# Altium schematic sheet Extended_design2_unvalidated.SchDoc
size A0; SheetNumber: 2; SheetTotal: 2
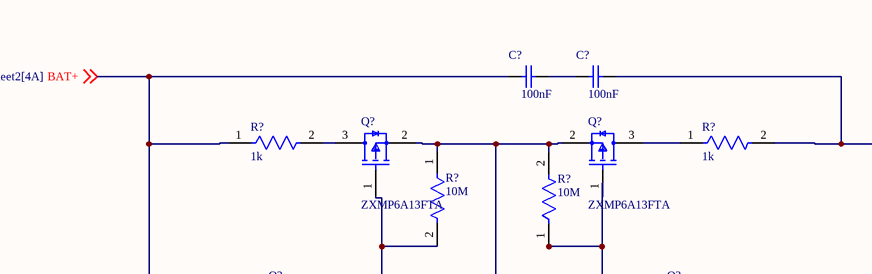
[diagram p0: Extended_design2_unvalidated.SchDoc, top left]
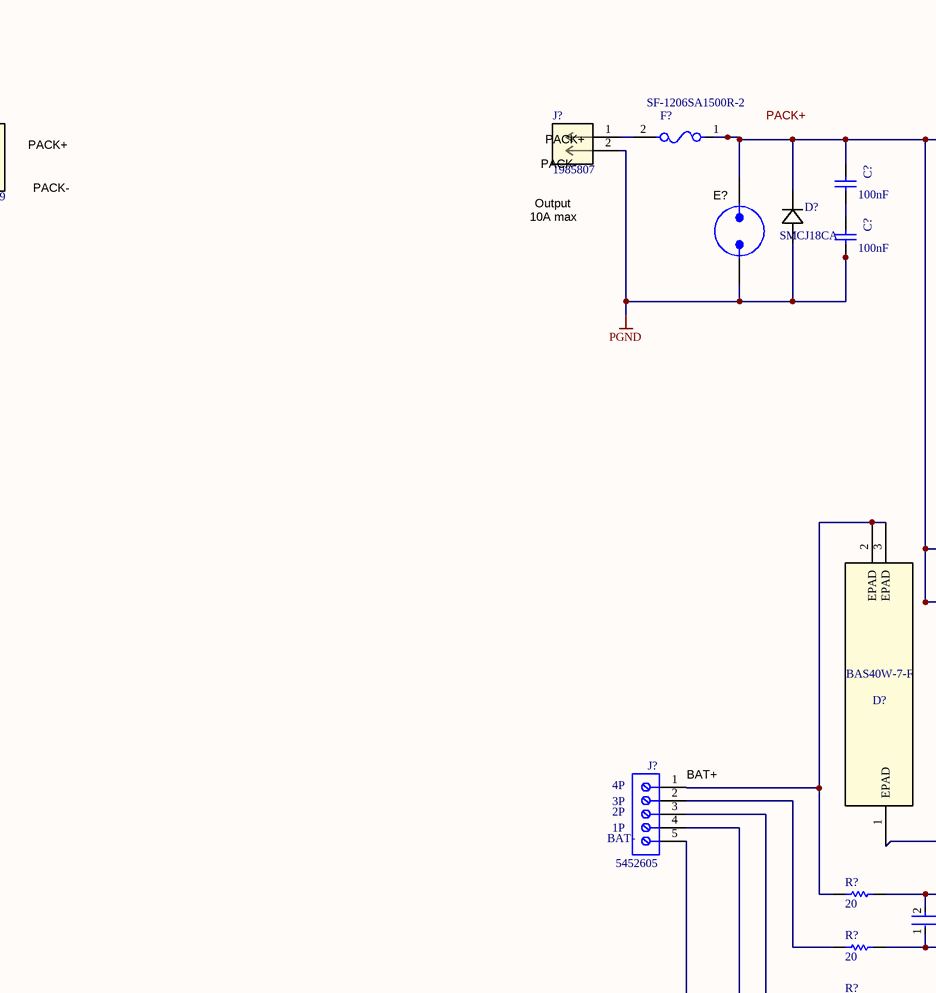
[diagram p1: Extended_design2_unvalidated.SchDoc, top middle]
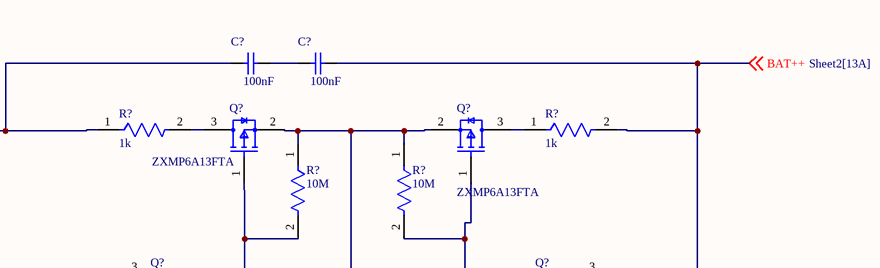
[diagram p2: Extended_design2_unvalidated.SchDoc, top right]
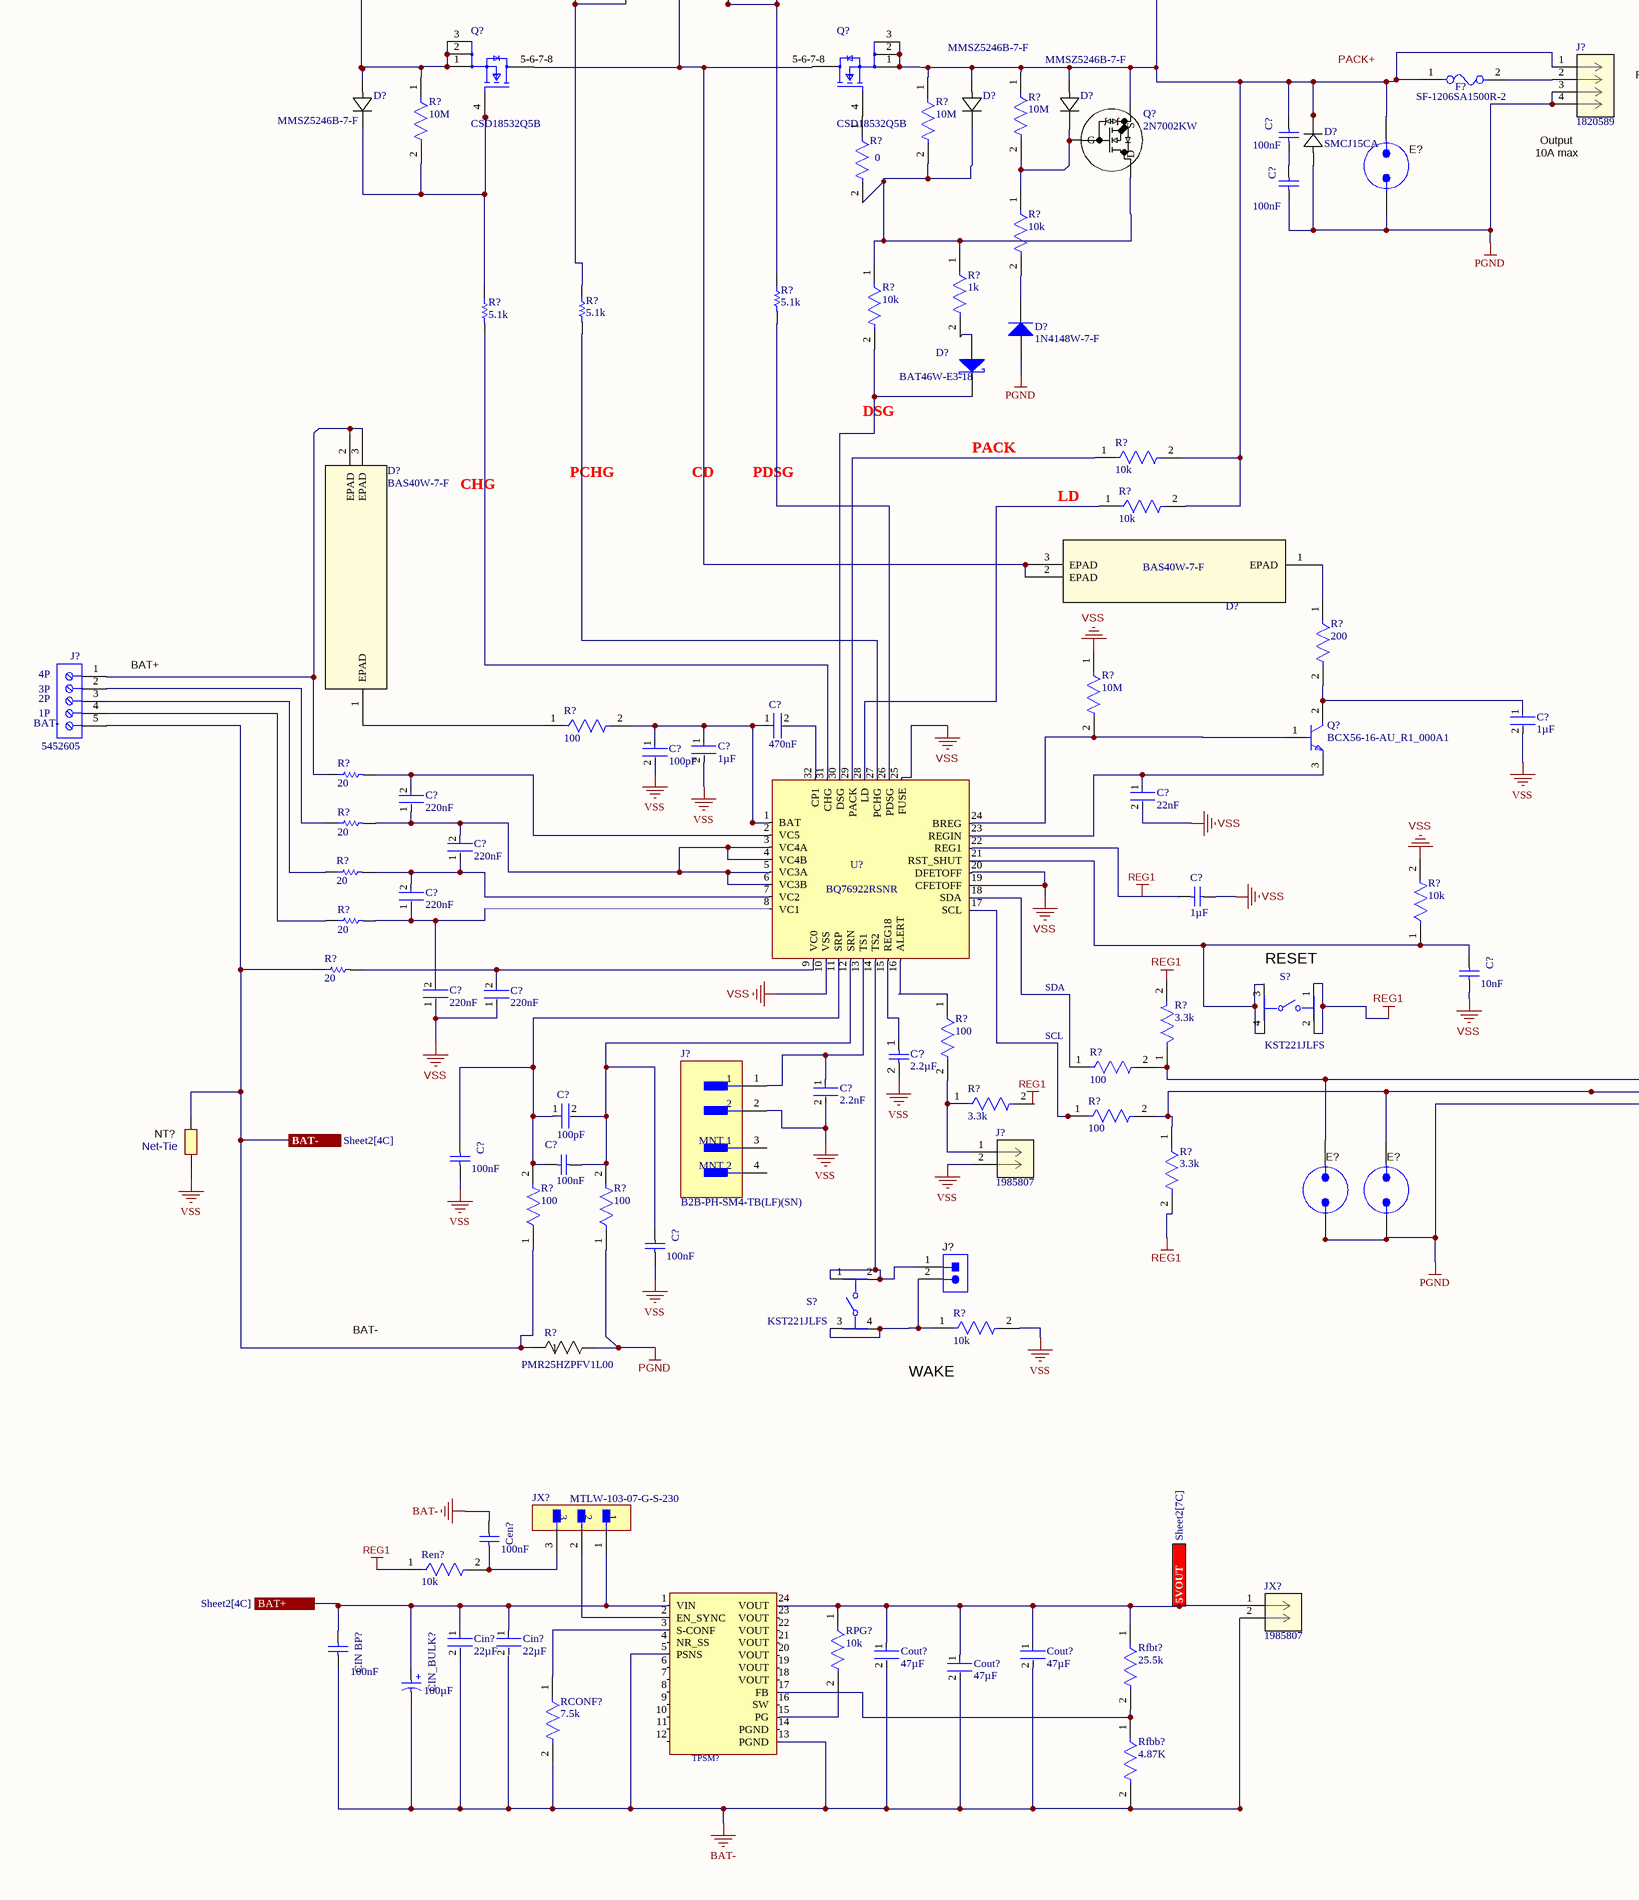
[diagram p3: Extended_design2_unvalidated.SchDoc, bottom left]
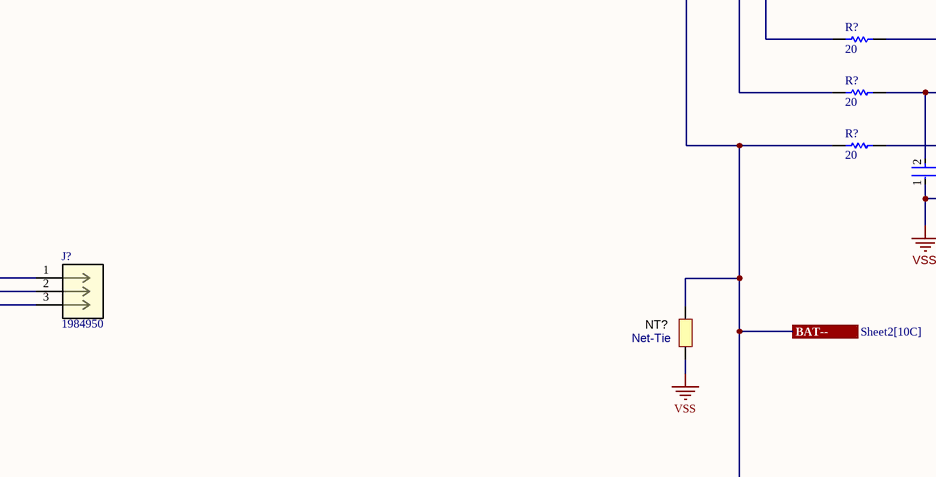
[diagram p4: Extended_design2_unvalidated.SchDoc, bottom middle]
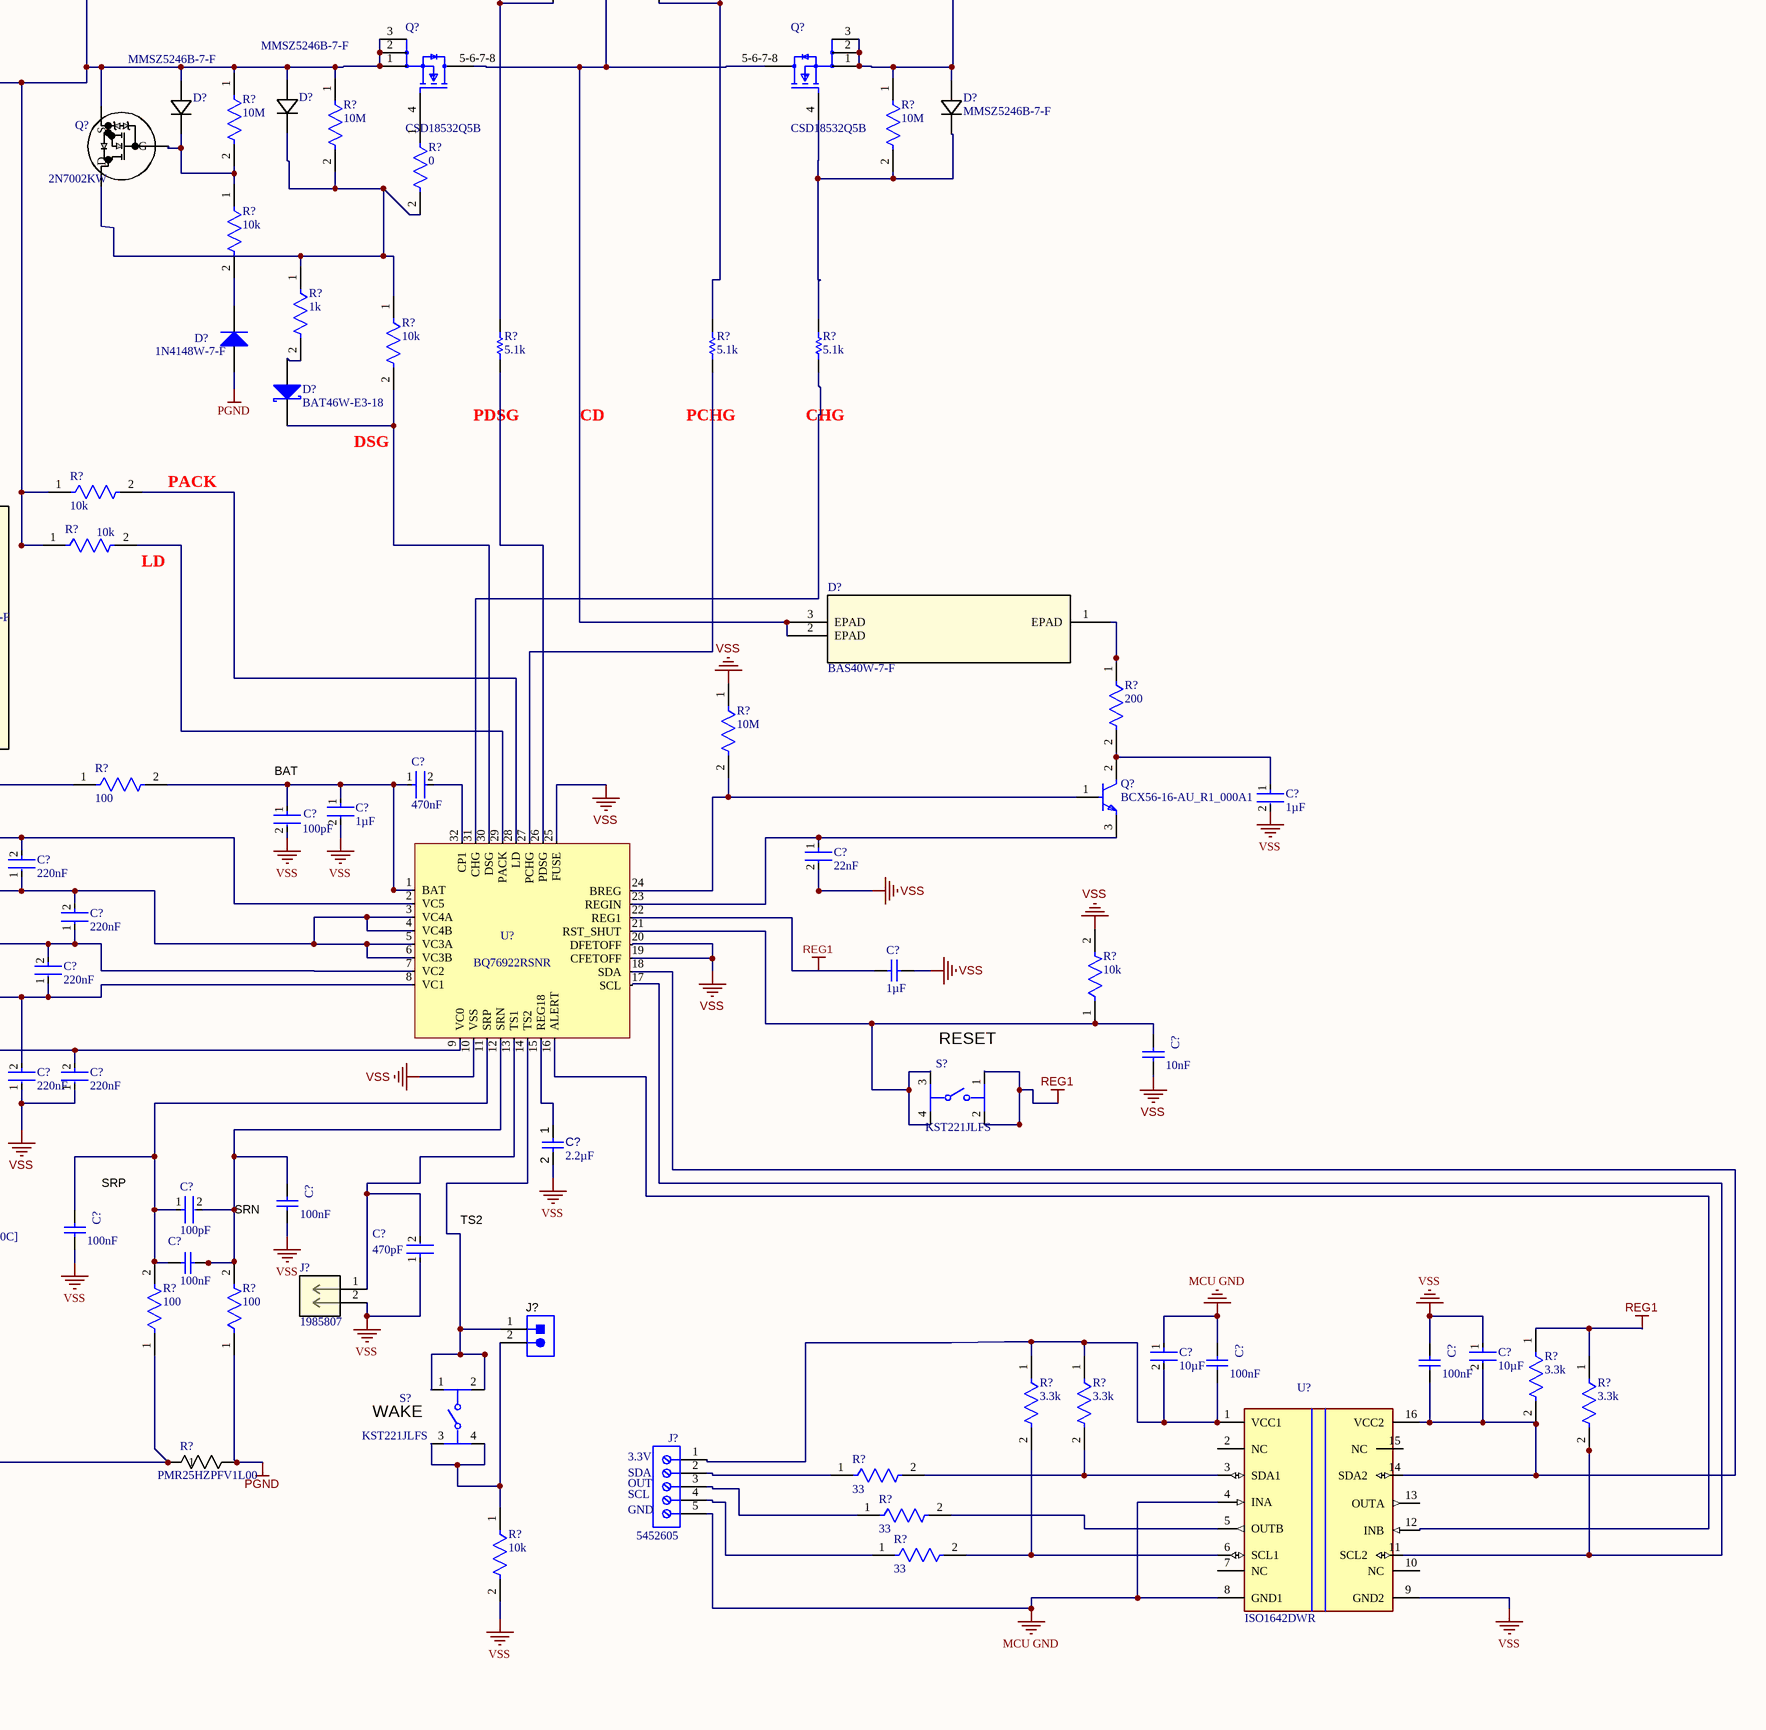
[diagram p5: Extended_design2_unvalidated.SchDoc, bottom right]

## Parts
(Parts that share a designator on the sheet are numbered #1, #2 ... from top to bottom, then left to right.)
C?#1  value 100nF  [WCAP-CSGP_0603_L1.6W0.8H0.8_Reflow]  (hidden comment: 885012206095)
C?#2  value 100nF  [WCAP-CSGP_0603_L1.6W0.8H0.8_Reflow]  (hidden comment: 885012206095)
C?#3  value 100nF  [WCAP-CSGP_0603_L1.6W0.8H0.8_Reflow]  (hidden comment: 885012206095)
C?#4  value 100nF  [WCAP-CSGP_0603_L1.6W0.8H0.8_Reflow]  (hidden comment: 885012206095)
C?#5  value 100nF  [WCAP-CSGP_0603_L1.6W0.8H0.8_Reflow]  (hidden comment: 885012206095)
C?#6  value 100nF  [WCAP-CSGP_0603_L1.6W0.8H0.8_Reflow]  (hidden comment: 885012206095)
C?#7  value 100nF  [WCAP-CSGP_0603_L1.6W0.8H0.8_Reflow]  (hidden comment: 885012206095)
C?#8  value 100nF  [WCAP-CSGP_0603_L1.6W0.8H0.8_Reflow]  (hidden comment: 885012206095)
C?#9  value 1µF  [FP-CGA5L-0_3-0_1-IPC_A]  (hidden comment: CGA5L3X7R1H105K160AB)
C?#10  value 470nF  [FP-GCM219-0_15-IPC_A]  (hidden comment: GCM219R71E474KA55D)
C?#11  value 1µF  [FP-CGA5L-0_3-0_1-IPC_A]  (hidden comment: CGA5L3X7R1H105K160AB)
C?#12  value 470nF  [FP-GCM219-0_15-IPC_A]  (hidden comment: GCM219R71E474KA55D)
C?#13  value 1µF  [FP-CGA5L-0_3-0_1-IPC_A]  (hidden comment: CGA5L3X7R1H105K160AB)
C?#14  value 1µF  [FP-CGA5L-0_3-0_1-IPC_A]  (hidden comment: CGA5L3X7R1H105K160AB)
C?#15  value 100pF  [FP-C0603C-CF-IPC_A]  (hidden comment: C0603C101J5GACTU)
C?#16  value 100pF  [FP-C0603C-CF-IPC_A]  (hidden comment: C0603C101J5GACTU)
C?#17  value 22nF  [FP-C0603C-CF-IPC_A]  (hidden comment: C0603C223K4RACTU)
C?#18  value 220nF  [FP-C1608-080-0_1-IPC_A]  (hidden comment: C1608X7R1H224K080AB)
C?#19  value 220nF  [FP-C1608-080-0_1-IPC_A]  (hidden comment: C1608X7R1H224K080AB)
C?#20  value 22nF  [FP-C0603C-CF-IPC_A]  (hidden comment: C0603C223K4RACTU)
C?#21  value 220nF  [FP-C1608-080-0_1-IPC_A]  (hidden comment: C1608X7R1H224K080AB)
C?#22  value 220nF  [FP-C1608-080-0_1-IPC_A]  (hidden comment: C1608X7R1H224K080AB)
C?#23  value 220nF  [FP-C1608-080-0_1-IPC_A]  (hidden comment: C1608X7R1H224K080AB)
C?#24  value 220nF  [FP-C1608-080-0_1-IPC_A]  (hidden comment: C1608X7R1H224K080AB)
C?#25  value 1µF  [CAPC2013X135X45ML10T25]  (hidden comment: GRM21BR71C105KA01L)
C?#26  value 1µF  [CAPC2013X135X45ML10T25]  (hidden comment: GRM21BR71C105KA01L)
C?#27  value 10nF  [WCAP-CSGP_0603_L1.6W0.8H0.8_Reflow]  (hidden comment: 885012206040)
C?#28  value 10nF  [WCAP-CSGP_0603_L1.6W0.8H0.8_Reflow]  (hidden comment: 885012206040)
C?#29  value 220nF  [FP-C1608-080-0_1-IPC_A]  (hidden comment: C1608X7R1H224K080AB)
C?#30  value 220nF  [FP-C1608-080-0_1-IPC_A]  (hidden comment: C1608X7R1H224K080AB)
C?#31  value 220nF  [FP-C1608-080-0_1-IPC_A]  (hidden comment: C1608X7R1H224K080AB)
C?#32  value 220nF  [FP-C1608-080-0_1-IPC_A]  (hidden comment: C1608X7R1H224K080AB)
C?#33  value 2.2µF  [FP-C2012-125-0_2-IPC_A]  (hidden comment: C2012X7R1C225K125AB)
C?#34  value 2.2µF  [FP-C2012-125-0_2-IPC_A]  (hidden comment: C2012X7R1C225K125AB)
C?#35  value 2.2nF  [FP-C0805C-DN-IPC_A]  (hidden comment: C0805C222K5RACTU)
C?#36  value 100nF  [WCAP-CSGP_0603_L1.6W0.8H0.8_Reflow]  (hidden comment: 885012206095)
C?#37  value 100nF  [WCAP-CSGP_0603_L1.6W0.8H0.8_Reflow]  (hidden comment: 885012206095)
C?#38  value 100pF  [FP-C0603C-CF-IPC_A]  (hidden comment: C0603C101J5GACTU)
C?#39  value 100pF  [FP-C0603C-CF-IPC_A]  (hidden comment: C0603C101J5GACTU)
C?#40  value 100nF  [WCAP-CSGP_0603_L1.6W0.8H0.8_Reflow]  (hidden comment: 885012206095)
C?#41  value 100nF  [WCAP-CSGP_0603_L1.6W0.8H0.8_Reflow]  (hidden comment: 885012206095)
C?#42  value 470pF  [FP-C0805C-DN-IPC_A]  (hidden comment: C0805C471J5GACTU)
C?#43  value 100nF  [WCAP-CSGP_0603_L1.6W0.8H0.8_Reflow]  (hidden comment: 885012206095)
C?#44  value 10µF  [FP-GRM21B-0_15-IPC_A]  (hidden comment: GRM21BR71A106KA73L)
C?#45  value 100nF  [WCAP-CSGP_0603_L1.6W0.8H0.8_Reflow]  (hidden comment: 885012206095)
C?#46  value 100nF  [WCAP-CSGP_0603_L1.6W0.8H0.8_Reflow]  (hidden comment: 885012206095)
C?#47  value 10µF  [FP-GRM21B-0_15-IPC_A]  (hidden comment: GRM21BR71A106KA73L)
C?#48  value 100nF  [WCAP-CSGP_0603_L1.6W0.8H0.8_Reflow]  (hidden comment: 885012206095)
Cen?  value 100nF  [WCAP-CSGP_0603_L1.6W0.8H0.8_Reflow]  (hidden comment: 885012206095)
Cin?#1  value 22µF  [FP-GRM21B-0_2-e0_2_0_7-MFG]  (hidden comment: GRM21BR61E226ME44L)
Cin?#2  value 22µF  [FP-GRM21B-0_2-e0_2_0_7-MFG]  (hidden comment: GRM21BR61E226ME44L)
CIN_BP?  value 100nF  [WCAP-CSGP_0603_L1.6W0.8H0.8_Reflow]  (hidden comment: 885012206095)
CIN_BULK?  value 100µF  [WCAP-ASLL_D6.3H7.7]  (hidden comment: 865060445005)
Cout?#1  value 47µF  [FP-GRM21B-0_2-e0_2_0_7-MFG]  (hidden comment: GRM21BR61A476ME15L)
Cout?#2  value 47µF  [FP-GRM21B-0_2-e0_2_0_7-MFG]  (hidden comment: GRM21BR61A476ME15L)
Cout?#3  value 47µF  [FP-GRM21B-0_2-e0_2_0_7-MFG]  (hidden comment: GRM21BR61A476ME15L)
D?#1  MMSZ5246B-7-F  [SOD123_DIO]
D?#2  MMSZ5246B-7-F  [SOD123_DIO]
D?#3  MMSZ5246B-7-F  [SOD123_DIO]
D?#4  MMSZ5246B-7-F  [SOD123_DIO]
D?#5  MMSZ5246B-7-F  [SOD123_DIO]
D?#6  MMSZ5246B-7-F  [SOD123_DIO]
D?#7  SMCJ15CA  [DIODE_DO-214AC]
D?#8  SMCJ18CA  [SMCJSeries_LTF]
D?#9  1N4148W-7-F  [DIOD-SOD123-2_V]
D?#10  1N4148W-7-F  [DIOD-SOD123-2_V]
D?#11  BAT46W-E3-18  [DIOD-SOD-123-2_V]
D?#12  BAT46W-E3-18  [DIOD-SOD-123-2_V]
D?#13  BAS40W-7-F  [SOT-323_DIO]
D?#14  BAS40W-7-F  [SOT-323_DIO]
D?#15  BAS40W-7-F  [SOT-323_DIO]
D?#16  BAS40W-7-F  [SOT-323_DIO]
E?#1  Spark Gap  [SPARK_GAP2]  (value not drawn)  (no BOM)
E?#2  Spark Gap  [SPARK_GAP2]  (value not drawn)  (no BOM)
E?#3  Spark Gap  [SPARK_GAP2]  (value not drawn)  (no BOM)
E?#4  Spark Gap  [SPARK_GAP2]  (value not drawn)  (no BOM)
F?#1  SF-1206SA1500R-2  [FP-SF-1206FP-MFG]
F?#2  SF-1206SA1500R-2  [FP-SF-1206FP-MFG]
J?#1  1820589  [CONN_1751264_PXC]
J?#2  1985807  [CONN_1751248_PXC]
J?#3  5452605  [691243110005]
J?#4  5452605  [691243110005]
J?#5  1984950  [CONN_1751251_PXC]
J?#6  B2B-PH-SM4-TB(LF)(SN)  [FP-B2B-PH-SM4-TB_LF_SN-MFG]
J?#7  1985807  [CONN_1751248_PXC]
J?#8  1985807  [CONN_1751248_PXC]
J?#9  PEC02SAAN  [CONN_PEC02SAAN]  (value not drawn)  (no BOM)
J?#10  PEC02SAAN  [CONN_PEC02SAAN]  (value not drawn)  (no BOM)
J?#11  5452605  [691243110005]
JX?#1  MTLW-103-07-G-S-230  [FP-MTLW-103-07-G-S-230-MFG]
JX?#2  1985807  [CONN_1751248_PXC]
NT?#1  Net-Tie  [Net-Tie_10milWide_30milLong]  (net tie, no BOM)
NT?#2  Net-Tie  [Net-Tie_10milWide_30milLong]  (net tie, no BOM)
Q?#1  ZXMP6A13FTA  [FP-SOT23-MFG]
Q?#2  ZXMP6A13FTA  [FP-SOT23-MFG]
Q?#3  ZXMP6A13FTA  [FP-SOT23-MFG]
Q?#4  ZXMP6A13FTA  [FP-SOT23-MFG]
Q?#5  CSD18532Q5B  [FP-DNK0008A-MFG]
Q?#6  CSD18532Q5B  [FP-DNK0008A-MFG]
Q?#7  CSD18532Q5B  [FP-DNK0008A-MFG]
Q?#8  CSD18532Q5B  [FP-DNK0008A-MFG]
Q?#9  2N7002KW  [SC-70_419AB-01_OSI]
Q?#10  2N7002KW  [SC-70_419AB-01_OSI]
Q?#11  BCX56-16-AU_R1_000A1  [FP-SOT89-MFG]
Q?#12  BCX56-16-AU_R1_000A1  [FP-SOT89-MFG]
R?#1  value 1k  [FP-CRCW2512-e3-MFG]  (hidden comment: CRCW25121K00JNEG)
R?#2  value 1k  [FP-CRCW2512-e3-MFG]  (hidden comment: CRCW25121K00JNEG)
R?#3  value 1k  [FP-CRCW2512-e3-MFG]  (hidden comment: CRCW25121K00JNEG)
R?#4  value 1k  [FP-CRCW2512-e3-MFG]  (hidden comment: CRCW25121K00JNEG)
R?#5  value 10M  [FP-CRCW0603-e3-IPC_A]  (hidden comment: CRCW060310M0JNEA)
R?#6  value 10M  [FP-CRCW0603-e3-IPC_A]  (hidden comment: CRCW060310M0JNEA)
R?#7  value 10M  [FP-CRCW0603-e3-IPC_A]  (hidden comment: CRCW060310M0JNEA)
R?#8  value 10M  [FP-CRCW0603-e3-IPC_A]  (hidden comment: CRCW060310M0JNEA)
R?#9  value 10M  [FP-CRCW0603-e3-IPC_A]  (hidden comment: CRCW060310M0JNEA)
R?#10  value 10M  [FP-CRCW0603-e3-IPC_A]  (hidden comment: CRCW060310M0JNEA)
R?#11  value 10M  [FP-CRCW0603-e3-IPC_A]  (hidden comment: CRCW060310M0JNEA)
R?#12  value 10M  [FP-CRCW0603-e3-IPC_A]  (hidden comment: CRCW060310M0JNEA)
R?#13  value 10M  [FP-CRCW0603-e3-IPC_A]  (hidden comment: CRCW060310M0JNEA)
R?#14  value 10M  [FP-CRCW0603-e3-IPC_A]  (hidden comment: CRCW060310M0JNEA)
R?#15  value 0  [FP-CRCW0603-HPe3-MFG]  (hidden comment: CRCW06030000Z0EAHP)
R?#16  value 0  [FP-CRCW0603-HPe3-MFG]  (hidden comment: CRCW06030000Z0EAHP)
R?#17  value 10k  [FP-CRCW0805-e3-IPC_A]  (hidden comment: CRCW080510K0FKEA)
R?#18  value 10k  [FP-CRCW0805-e3-IPC_A]  (hidden comment: CRCW080510K0FKEA)
R?#19  value 1k  [FP-CRCW0603-e3-IPC_A]  (hidden comment: CRCW06031K00JNEA)
R?#20  value 1k  [FP-CRCW0603-e3-IPC_A]  (hidden comment: CRCW06031K00JNEA)
R?#21  value 10k  [FP-CRCW0805-e3-IPC_A]  (hidden comment: CRCW080510K0FKEA)
R?#22  value 10k  [FP-CRCW0805-e3-IPC_A]  (hidden comment: CRCW080510K0FKEA)
R?#23  value 5.1k  [RESC2013X50X30ML20T20]  (hidden comment: CRCW08055K10JNEA)
R?#24  value 5.1k  [RESC2013X50X30ML20T20]  (hidden comment: CRCW08055K10JNEA)
R?#25  value 5.1k  [RESC2013X50X30ML20T20]  (hidden comment: CRCW08055K10JNEA)
R?#26  value 5.1k  [RESC2013X50X30ML20T20]  (hidden comment: CRCW08055K10JNEA)
R?#27  value 5.1k  [RESC2013X50X30ML20T20]  (hidden comment: CRCW08055K10JNEA)
R?#28  value 5.1k  [RESC2013X50X30ML20T20]  (hidden comment: CRCW08055K10JNEA)
R?#29  value 10k  [FP-CRCW0805-e3-IPC_A]  (hidden comment: CRCW080510K0FKEA)
R?#30  value 10k  [FP-CRCW0805-e3-IPC_A]  (hidden comment: CRCW080510K0FKEA)
R?#31  value 10k  [FP-CRCW0805-e3-IPC_A]  (hidden comment: CRCW080510K0FKEA)
R?#32  value 10k  [FP-CRCW0805-e3-IPC_A]  (hidden comment: CRCW080510K0FKEA)
R?#33  value 200  [FP-CRCW2512-e3-MFG]  (hidden comment: CRCW2512200RJNEG)
R?#34  value 200  [FP-CRCW2512-e3-MFG]  (hidden comment: CRCW2512200RJNEG)
R?#35  value 10M  [FP-CRCW0603-e3-IPC_A]  (hidden comment: CRCW060310M0JNEA)
R?#36  value 10M  [FP-CRCW0603-e3-IPC_A]  (hidden comment: CRCW060310M0JNEA)
R?#37  value 100  [FP-CRCW0603-e3-IPC_A]  (hidden comment: CRCW0603100RJNEA)
R?#38  value 100  [FP-CRCW0603-e3-IPC_A]  (hidden comment: CRCW0603100RJNEA)
R?#39  value 20  [RESC3216X60X45ML10T20]  (hidden comment: CRCW120620R0FKEA)
R?#40  value 20  [RESC3216X60X45ML10T20]  (hidden comment: CRCW120620R0FKEA)
R?#41  value 20  [RESC3216X60X45ML10T20]  (hidden comment: CRCW120620R0FKEA)
R?#42  value 20  [RESC3216X60X45ML10T20]  (hidden comment: CRCW120620R0FKEA)
R?#43  value 20  [RESC3216X60X45ML10T20]  (hidden comment: CRCW120620R0FKEA)
R?#44  value 20  [RESC3216X60X45ML10T20]  (hidden comment: CRCW120620R0FKEA)
R?#45  value 20  [RESC3216X60X45ML10T20]  (hidden comment: CRCW120620R0FKEA)
R?#46  value 20  [RESC3216X60X45ML10T20]  (hidden comment: CRCW120620R0FKEA)
R?#47  value 10k  [FP-CRCW0805-e3-IPC_A]  (hidden comment: CRCW080510K0FKEA)
R?#48  value 10k  [FP-CRCW0805-e3-IPC_A]  (hidden comment: CRCW080510K0FKEA)
R?#49  value 20  [RESC3216X60X45ML10T20]  (hidden comment: CRCW120620R0FKEA)
R?#50  value 20  [RESC3216X60X45ML10T20]  (hidden comment: CRCW120620R0FKEA)
R?#51  value 100  [FP-CRCW0603-e3-IPC_A]  (hidden comment: CRCW0603100RJNEA)
R?#52  value 100  [FP-CRCW0603-e3-IPC_A]  (hidden comment: CRCW0603100RJNEA)
R?#53  value 3.3k  [FP-AC0805-IPC_A]  (hidden comment: AC0805JR-073K3L)
R?#54  value 3.3k  [FP-AC0805-IPC_A]  (hidden comment: AC0805JR-073K3L)
R?#55  value 100  [FP-CRCW0603-e3-IPC_A]  (hidden comment: CRCW0603100RJNEA)
R?#56  value 3.3k  [FP-AC0805-IPC_A]  (hidden comment: AC0805JR-073K3L)
R?#57  value 3.3k  [FP-AC0805-IPC_A]  (hidden comment: AC0805JR-073K3L)
R?#58  value 100  [FP-CRCW0603-e3-IPC_A]  (hidden comment: CRCW0603100RJNEA)
R?#59  value 100  [FP-CRCW0603-e3-IPC_A]  (hidden comment: CRCW0603100RJNEA)
R?#60  value 3.3k  [FP-AC0805-IPC_A]  (hidden comment: AC0805JR-073K3L)
R?#61  value 3.3k  [FP-AC0805-IPC_A]  (hidden comment: AC0805JR-073K3L)
R?#62  value 3.3k  [FP-AC0805-IPC_A]  (hidden comment: AC0805JR-073K3L)
R?#63  value 100  [FP-CRCW0603-e3-IPC_A]  (hidden comment: CRCW0603100RJNEA)
R?#64  value 100  [FP-CRCW0603-e3-IPC_A]  (hidden comment: CRCW0603100RJNEA)
R?#65  value 10k  [FP-CRCW0805-e3-IPC_A]  (hidden comment: CRCW080510K0FKEA)
R?#66  PMR25HZPFV1L00  [RES_R1210_ROM]
R?#67  PMR25HZPFV1L00  [RES_R1210_ROM]
R?#68  value 33  [FP-AC0603-MFG]  (hidden comment: AC0603FR-0733RL)
R?#69  value 10k  [FP-CRCW0805-e3-IPC_A]  (hidden comment: CRCW080510K0FKEA)
R?#70  value 33  [FP-AC0603-MFG]  (hidden comment: AC0603FR-0733RL)
R?#71  value 33  [FP-AC0603-MFG]  (hidden comment: AC0603FR-0733RL)
RCONF?  value 7.5k  [FP-CRCW0805-HPe3-IPC_A]  (hidden comment: CRCW08057K50FKEA)
Ren?  value 10k  [FP-CRCW0805-e3-IPC_A]  (hidden comment: CRCW080510K0FKEA)
Rfbb?  value 4.87K  [FP-CRCW0805-e3-IPC_A]  (hidden comment: RC0805FR-074K87L)
Rfbt?  value 25.5k  [FP-CRCW0805-e3-IPC_A]  (hidden comment: CRCW080525K5FKEA)
RPG?  value 10k  [FP-CRCW0805-e3-IPC_A]  (hidden comment: CRCW080510K0FKEA)
S?#1  KST221JLFS  [FP-KSC2_TE_01J_LFS-MFG]
S?#2  KST221JLFS  [FP-KSC2_TE_01J_LFS-MFG]
S?#3  KST221JLFS  [FP-KSC2_TE_01J_LFS-MFG]
S?#4  KST221JLFS  [FP-KSC2_TE_01J_LFS-MFG]
TPSM?  PTPSM82913RDUR  [B0QFN28_RDU_TEX]  (value not drawn)
U?#1  BQ76922RSNR  [QFN32_RSN_TEX-M]
U?#2  BQ76922RSNR  [QFN32_RSN_TEX-M]
U?#3  ISO1642DWR  [FP-DW0016B-IPC_C]

## Ports
5VOUT (see Sheet2[7C]), BAT+ (see Sheet2[4C]), BAT- (see Sheet2[4C]), BAT-- (see Sheet2[10C])

## Nets
BAT-: Cen?.1 Cin?#1.2 CIN_BP?.2 CIN_BULK?.2(N) Cout?#1.2 Cout?#2.2 Cout?#3.2 JX?#2.2 RCONF?.2 Rfbb?.2 TPSM?.5(PSNS) TPSM?.13(PGND)
MCU GND: C?#44.1 C?#45.1 J?#11.5 U?#3.4(INA) U?#3.8(GND1)
PGND: C?#7.2 C?#8.2 D?#7.2 D?#8.2 D?#9.1(A) D?#10.1(A) E?#1.2 E?#2.2 E?#3.2 E?#4.2 J?#1.3 J?#1.4 J?#2.2 J?#5.3 R?#59.1 R?#64.1 R?#66.2 R?#67.2
REG1: C?#25.1 C?#26.1 R?#56.2 R?#57.1 R?#62.1 Ren?.1 S?#1.1 S?#1.2 S?#2.1 S?#2.2 U?#1.22(REG1) U?#2.22(REG1)
VSS: C?#9.2 C?#11.2 C?#13.2 C?#14.2 C?#15.2 C?#16.2 C?#17.2 C?#20.2 C?#25.2 C?#26.2 C?#27.2 C?#28.2 C?#29.1 C?#30.1 C?#31.1 C?#32.1 C?#33.2 C?#34.2 C?#35.2 C?#36.2 C?#37.2 C?#40.2 C?#42.1 C?#46.1 C?#47.1 C?#48.2 J?#6.2 J?#7.2 J?#8.2 NT?#1.1 NT?#2.1 R?#35.1 R?#36.1 R?#47.2 R?#48.2 R?#65.2 R?#69.2 U?#1.10(VSS) U?#1.19(CFETOFF) U?#1.20(DFETOFF) U?#1.25(FUSE) U?#2.10(VSS) U?#2.19(CFETOFF) U?#2.20(DFETOFF) U?#2.25(FUSE) U?#3.9(GND2)
5VOUT: Cout?#1.1 Cout?#2.1 Cout?#3.1 JX?#2.1 Rfbt?.1 RPG?.1 TPSM?.24(VOUT) ; port 5VOUT
BAT+: Cin?#1.1 Cin?#2.1 CIN_BP?.1 CIN_BULK?.1(P) JX?#1.1 TPSM?.1(VIN) ; port BAT+
BAT+: C?#3.1 D?#4.2 Q?#7.1(S) Q?#7.2(S) Q?#7.3(S) R?#3.1 R?#13.1 ; off-sheet BAT+  [a separate net that carries the same name]
BAT++: C?#2.2 D?#3.2 Q?#6.1(S) Q?#6.2(S) Q?#6.3(S) R?#2.2 R?#11.1 ; off-sheet BAT++
BAT-: J?#4.5 NT?#2.2 R?#50.1 R?#63.1 R?#67.1 ; port BAT-  [a separate net that carries the same name]
BAT--: J?#3.5 NT?#1.2 R?#49.1 R?#58.1 R?#66.1 ; port BAT--
NetC?#1_1: C?#1.1 C?#5.1 D?#1.2 D?#2.2 D?#8.1 E?#1.1 F?#1.1 Q?#5.1(S) Q?#5.2(S) Q?#5.3(S) Q?#9.2(S) R?#1.1 R?#9.1 R?#10.1 R?#29.1 R?#31.1
NetC?#1_2: C?#1.2 C?#2.1
NetC?#3_2: C?#3.2 C?#4.1
NetC?#4_2: C?#4.2 C?#6.1 D?#5.2 D?#6.2 D?#7.1 E?#2.1 F?#2.1 J?#1.1 Q?#8.1(S) Q?#8.2(S) Q?#8.3(S) Q?#10.2(S) R?#4.2 R?#12.1 R?#14.1 R?#30.2 R?#32.2
NetC?#5_2: C?#5.2 C?#7.1
NetC?#6_2: C?#6.2 C?#8.1
NetC?#9_1: C?#9.1 Q?#12.2(C) R?#33.2
NetC?#10_1: C?#10.1 C?#13.1 C?#15.1 R?#37.2 U?#1.1(BAT)
NetC?#10_2: C?#10.2 U?#1.32(CP1)
NetC?#11_1: C?#11.1 Q?#11.2(C) R?#34.2
NetC?#12_1: C?#12.1 C?#14.1 C?#16.1 R?#38.2 U?#2.1(BAT)
NetC?#12_2: C?#12.2 U?#2.32(CP1)
NetC?#17_1: C?#17.1 Q?#11.3(E) U?#1.23(REGIN)
NetC?#18_1: C?#18.1 C?#21.2 R?#41.2 U?#1.3(VC4A) U?#1.4(VC4B) U?#1.5(VC3A) U?#1.6(VC3B)
NetC?#18_2: C?#18.2 R?#39.2 U?#1.2(VC5)
NetC?#19_1: C?#19.1 C?#22.2 R?#42.2 U?#2.3(VC4A) U?#2.4(VC4B) U?#2.5(VC3A) U?#2.6(VC3B)
NetC?#19_2: C?#19.2 R?#40.2 U?#2.2(VC5)
NetC?#20_1: C?#20.1 Q?#12.3(E) U?#2.23(REGIN)
NetC?#21_1: C?#21.1 C?#23.2 R?#43.2 U?#1.7(VC2)
NetC?#22_1: C?#22.1 C?#24.2 R?#44.2 U?#2.7(VC2)
NetC?#23_1: C?#23.1 C?#29.2 R?#45.2 U?#1.8(VC1)
NetC?#24_1: C?#24.1 C?#31.2 R?#46.2 U?#2.8(VC1)
NetC?#27_1: C?#27.1 R?#47.1 S?#1.3 S?#1.4 U?#1.21(RST_SHUT)
NetC?#28_1: C?#28.1 R?#48.1 S?#2.3 S?#2.4 U?#2.21(RST_SHUT)
NetC?#30_2: C?#30.2 R?#49.2 U?#1.9(VC0)
NetC?#32_2: C?#32.2 R?#50.2 U?#2.9(VC0)
NetC?#33_1: C?#33.1 U?#1.15(REG18)
NetC?#34_1: C?#34.1 U?#2.15(REG18)
NetC?#35_1: C?#35.1 J?#6.1 U?#2.13(TS1)
NetC?#36_1: C?#36.1 C?#38.2 C?#41.2 R?#59.2 U?#1.12(SRN)
NetC?#37_1: C?#37.1 C?#38.1 C?#41.1 R?#58.2 U?#1.11(SRP)
NetC?#39_1: C?#39.1 C?#40.1 C?#43.1 R?#63.2 U?#2.11(SRP)
NetC?#39_2: C?#39.2 C?#43.2 C?#48.1 R?#64.2 U?#2.12(SRN)
NetC?#42_2: C?#42.2 J?#8.1 U?#1.13(TS1)
NetC?#44_2: C?#44.2 C?#45.2 J?#11.1 R?#60.1 R?#61.1 U?#3.1(VCC1)
NetC?#46_2: C?#46.2 C?#47.2 R?#57.2 U?#1.18(SDA) U?#3.14(SDA2) U?#3.16(VCC2)
NetCen?_2: Cen?.2 JX?#1.3 Ren?.2
NetD?#1_1: D?#1.1 Q?#9.1(G) R?#9.2 R?#17.1
NetD?#2_1: D?#2.1 Q?#9.3(D) R?#10.2 R?#15.2 R?#19.1 R?#22.1
NetD?#3_1: D?#3.1 Q?#6.4(G) R?#11.2 R?#28.1
NetD?#4_1: D?#4.1 Q?#7.4(G) R?#13.2 R?#25.1
NetD?#5_1: D?#5.1 Q?#10.3(D) R?#14.2 R?#16.2 R?#20.1 R?#21.1
NetD?#6_1: D?#6.1 Q?#10.1(G) R?#12.2 R?#18.1
NetD?#9_2: D?#9.2(K) R?#17.2
NetD?#10_2: D?#10.2(K) R?#18.2
NetD?#11_1: D?#11.1(A) R?#19.2
NetD?#11_2: D?#11.2(K) R?#22.2 U?#1.30(DSG)
NetD?#12_1: D?#12.1(A) R?#20.2
NetD?#12_2: D?#12.2(K) R?#21.2 U?#2.30(DSG)
NetD?#13_1: D?#13.1(EPAD) R?#33.1
NetD?#13_2: D?#13.2(EPAD) D?#13.3(EPAD) Q?#3.2(S) Q?#4.2(S) Q?#7.5-6-7-8(D) Q?#8.5-6-7-8(D) R?#7.1 R?#8.2
NetD?#14_1: D?#14.1(EPAD) R?#34.1
NetD?#14_2: D?#14.2(EPAD) D?#14.3(EPAD) Q?#1.2(S) Q?#2.2(S) Q?#5.5-6-7-8(D) Q?#6.5-6-7-8(D) R?#5.1 R?#6.1
NetD?#15_1: D?#15.1(EPAD) R?#37.1
NetD?#15_2: D?#15.2(EPAD) D?#15.3(EPAD) J?#3.1 R?#39.1
NetD?#16_1: D?#16.1(EPAD) R?#38.1
NetD?#16_2: D?#16.2(EPAD) D?#16.3(EPAD) J?#4.1 R?#40.1
NetE?#3_1: E?#3.1 J?#5.1 R?#52.2 R?#53.1
NetE?#4_1: E?#4.1 J?#5.2 R?#55.2 R?#56.1
NetF?#1_2: F?#1.2 J?#2.1
NetF?#2_2: F?#2.2 J?#1.2
NetJ?#3_2: J?#3.2 R?#41.1
NetJ?#3_3: J?#3.3 R?#43.1
NetJ?#3_4: J?#3.4 R?#45.1
NetJ?#4_2: J?#4.2 R?#42.1
NetJ?#4_3: J?#4.3 R?#44.1
NetJ?#4_4: J?#4.4 R?#46.1
NetJ?#7_1: J?#7.1 R?#51.2 R?#54.1
NetJ?#9_1: J?#9.1 S?#3.1 S?#3.2 U?#1.14(TS2)
NetJ?#9_2: J?#9.2 R?#69.1 S?#3.3 S?#3.4
NetJ?#10_1: J?#10.1 S?#4.1 S?#4.2 U?#2.14(TS2)
NetJ?#10_2: J?#10.2 R?#65.1 S?#4.3 S?#4.4
NetJ?#11_2: J?#11.2 R?#68.1
NetJ?#11_3: J?#11.3 R?#70.1
NetJ?#11_4: J?#11.4 R?#71.1
NetJX?#1_2: JX?#1.2 TPSM?.2(EN_SYNC)
NetQ?#1_1: Q?#1.1(G) R?#5.2 R?#26.1
NetQ?#1_3: Q?#1.3(D) R?#1.2
NetQ?#2_1: Q?#2.1(G) R?#6.2 R?#27.1
NetQ?#2_3: Q?#2.3(D) R?#2.1
NetQ?#3_1: Q?#3.1(G) R?#7.2 R?#24.1
NetQ?#3_3: Q?#3.3(D) R?#3.2
NetQ?#4_1: Q?#4.1(G) R?#8.1 R?#23.1
NetQ?#4_3: Q?#4.3(D) R?#4.1
NetQ?#5_4: Q?#5.4(G) R?#15.1
NetQ?#8_4: Q?#8.4(G) R?#16.1
NetQ?#11_1: Q?#11.1(B) R?#35.2 U?#1.24(BREG)
NetQ?#12_1: Q?#12.1(B) R?#36.2 U?#2.24(BREG)
NetR?#23_2: R?#23.2 U?#2.26(PDSG)
NetR?#24_2: R?#24.2 U?#2.27(PCHG)
NetR?#25_2: R?#25.2 U?#2.31(CHG)
NetR?#26_2: R?#26.2 U?#1.26(PDSG)
NetR?#27_2: R?#27.2 U?#1.27(PCHG)
NetR?#28_2: R?#28.2 U?#1.31(CHG)
NetR?#29_2: R?#29.2 U?#1.28(LD)
NetR?#30_1: R?#30.1 U?#2.29(PACK)
NetR?#31_2: R?#31.2 U?#1.29(PACK)
NetR?#32_1: R?#32.1 U?#2.28(LD)
NetR?#51_1: R?#51.1 U?#2.16(ALERT)
NetR?#52_1: R?#52.1 U?#2.18(SDA)
NetR?#55_1: R?#55.1 U?#2.17(SCL)
NetR?#60_2: R?#60.2 R?#71.2 U?#3.6(SCL1)
NetR?#61_2: R?#61.2 R?#68.2 U?#3.3(SDA1)
NetR?#62_2: R?#62.2 U?#3.11(SCL2)
NetR?#70_2: R?#70.2 U?#3.5(OUTB)
NetRCONF?_1: RCONF?.1 TPSM?.3(S-CONF)
NetRfbb?_1: Rfbb?.1 Rfbt?.2 TPSM?.17(FB)
NetRPG?_2: RPG?.2 TPSM?.15(PG)
NetU?#1_16: U?#1.16(ALERT) U?#3.12(INB)

Not connected (* = marked no-connect by the designer): Cin?#2 2; J?#6 3(MNT_1) 4(MNT_2); R?#53 2; R?#54 2; TPSM? 4(NR_SS) 6 7 8 9 10 11 12 14(PGND) 16(SW) 18(VOUT) 19(VOUT) 20(VOUT) 21(VOUT) 22(VOUT) 23(VOUT); U?#1 17(SCL); U?#3 2(NC) 7(NC) 10(NC) 13(OUTA) 15(NC)

## Notes on the sheet
- PACK+
- PACK-
- (near J?#2) PACK-
- (near J?#2) PACK+
- (near J?#1) Output
- (near J?#1) 10A max
- (near J?#2) Output
- 10A max
- DSG
- (near R?#26) PDSG
- CD
- (near R?#27) PCHG
- (near R?#28) CHG
- CHG
- PCHG
- PDSG
- PACK
- (near R?#29) PACK
- LD
- (near R?#31) LD
- (near J?#4) 4P
- (near J?#4) BAT+
- (near J?#3) 4P
- (near J?#3) 3P
- (near J?#3) BAT+
- (near J?#4) BAT-
- (near J?#4) 3P
- (near J?#4) 2P
- (near J?#4) 1P
- (near J?#3) BAT-
- (near J?#3) 2P
- (near J?#3) 1P
- (near C?#15) BAT
- SDA
- (near S?#2) RESET
- RESET
- (near R?#52) SCL
- (near C?#37) SRP
- (near C?#36) SRN
- (near C?#42) TS2
- (near S?#3) WAKE
- BAT-
- (near J?#11) 3.3V
- (near J?#11) SDA
- (near J?#11) OUT
- WAKE
- (near J?#11) SCL
- (near J?#11) GND
- Labels drawn without touching a wire or pin: PACK+, REG1
- (in symbol CMP-001-00083-1) +

## Library data of the parts
C?#1-C?#8 C?#36 C?#37 C?#40 C?#41 C?#43 C?#45 C?#46 C?#48 Cen? CIN_BP? = CMP-001-00099-1: Ceramic Capacitor, Multilayer, Ceramic, 50V, 10% +Tol, 10% -Tol, X7R, 15% TC, 0.1uF, Surface Mount, 0603; Voltage Rating: 50V; Min Operating Temperature: -55°C; Mounting Technology: Surface Mount; Case/Package: 0603; Tolerance: 10%; Max Operating Temperature: 125°C
C?#9 C?#11 C?#13 C?#14 = CMP-001-00096-1: CGA Series 1206 1 uF 50 V ±10 % Tolerance X7R SMT Multilayer Ceramic Capacitor; Tolerance: 10%; Voltage Rating: 50V; Max Operating Temperature: 125°C; Case/Package: 1206; Min Operating Temperature: -55°C; Mounting Technology: Surface Mount
C?#10 C?#12 = CMP-001-00095-1: 25V 470nF X7R ±10% 0805 Multilayer Ceramic Capacitors MLCC - SMD/SMT ROHS; Tolerance: 10%; Max Operating Temperature: 125°C; Voltage Rating: 25V; Min Operating Temperature: -55°C; Case/Package: 0805; Mounting Technology: Surface Mount
C?#15 C?#16 C?#38 C?#39 = CMP-001-00094-1: Multilayer Ceramic Capacitors MLCC - SMD/SMT 50V 100pF C0G 0603 5%; Min Operating Temperature: -55°C; Tolerance: 5%; Voltage Rating: 50V; Mounting Technology: Surface Mount; Case/Package: 0603; Max Operating Temperature: 125°C; Pins: 2
C?#17 C?#20 = CMP-001-00088-1: Multilayer Ceramic Capacitors MLCC - SMD/SMT 16V 0.022uF X7R 0603 10%; Voltage Rating: 16V; Mounting Technology: Surface Mount; Pins: 2; Tolerance: 10%; Case/Package: 0603; Max Operating Temperature: 125°C; Min Operating Temperature: -55°C
C?#18 C?#19 C?#21-C?#24 C?#29-C?#32 = CMP-001-00097-1: 50V 220nF X7R 卤10% 0603 Multilayer Ceramic Capacitors MLCC - SMD/SMT ROHS; Tolerance: 10%; Voltage Rating: 50V; Pins: 2; Mounting Technology: Surface Mount; Case/Package: 0603; Min Operating Temperature: -55°C; Max Operating Temperature: 125°C
C?#25 C?#26 = CMP-001-00090-1: 0805 1 uF 16 V ±10% Tolerance X7R SMT Multilayer Ceramic Capacitor; Voltage Rating: 16V; Case/Package: 0805; Min Operating Temperature: -55°C; Mounting Technology: Surface Mount; Pins: 2; Max Operating Temperature: 125°C; Tolerance: 10%
C?#27 C?#28 = CMP-001-00091-1: Capacitor 10NF Multilayer Ceramic Mlcc 16 V , X7R Dielectric 0603 Surface Mount; Voltage Rating: 16V; Tolerance: 10%; Max Operating Temperature: 125°C; Mounting Technology: Surface Mount; Case/Package: 0603; Min Operating Temperature: -55°C
C?#33 C?#34 = CMP-001-00092-1: C Series 0805 2.2 uF 16 V ±10 % Tolerance X7R SMT Multilayer Ceramic Capacitor; Voltage Rating: 16V; Tolerance: 10%; Max Operating Temperature: 125°C; Pins: 2; Min Operating Temperature: -55°C; Case/Package: 0805; Mounting Technology: Surface Mount
C?#35 = CMP-001-00087-1: Multilayer Ceramic Capacitors MLCC - SMD/SMT 50V 2200pF X7R 0805 10%; Mounting Technology: Surface Mount; Tolerance: 10%; Min Operating Temperature: -55°C; Max Operating Temperature: 125°C; Pins: 2; Case/Package: 0805; Voltage Rating: 50V
C?#42 = CMP-001-00093-1: SMD Comm C0G 0805 (2012Metric) Ceramic Capacitor 0.079Lx0.049W 2.00mmx1.25mm C0G NP0 ±5% 470pF; Voltage Rating: 50V; Max Operating Temperature: 125°C; Mounting Technology: Surface Mount; Case/Package: 0805; Tolerance: 5%; Pins: 2; Min Operating Temperature: -55°C
C?#44 C?#47 = CMP-001-00098-1: 10V 10uF X7R ±10% 0805 Multilayer Ceramic Capacitors MLCC - SMD/SMT ROHS; Min Operating Temperature: -55°C; Pins: 2; Mounting Technology: Surface Mount; Case/Package: 0805; Tolerance: 10%; Voltage Rating: 10V; Max Operating Temperature: 125°C
Cin?#1 Cin?#2 = CMP-001-00085-1: 25V 22uF X5R ±20% 0805 Multilayer Ceramic Capacitors MLCC - SMD/SMT ROHS; Tolerance: 20%; Mounting Technology: Surface Mount; Voltage Rating: 25V; Min Operating Temperature: -55°C; Case/Package: 0805; Max Operating Temperature: 85°C
CIN_BULK? = CMP-001-00083-1: WCAP-ASLL Aluminum Electrolytic Capacitors; Voltage Rating: 25V; Ripple Current: 300mA; Min Operating Temperature: -55°C; Case/Package: Radial; Max Operating Temperature: 105°C; Ripple Current (AC): 300mA
Cout?#1-Cout?#3 = CMP-001-00084-1: 10V 47uF X5R ±20% 0805 Multilayer Ceramic Capacitors MLCC - SMD/SMT ROHS; Voltage Rating: 10V; Tolerance: 20%; Min Operating Temperature: -55°C; Mounting Technology: Surface Mount; Case/Package: 0805; Max Operating Temperature: 85°C
D?#1-D?#6 = MMSZ5246B-7-F: Description; Manufacturer_Name: Diodes Inc; Copyright: Copyright (C) 2025 Ultra Librarian. All rights reserved.; Manufacturer_Part_Number: MMSZ5246B-7-F
D?#7 = SMCJ15CA: No Description Available; Manufacturer_Name: Bourns Electronics; Copyright: Copyright (C) 2026 Ultra Librarian. All rights reserved.; Manufacturer_Part_Number: SMCJ15CA
D?#8 = SMCJ18CA: No Description Available; Manufacturer_Name: Littelfuse Inc; Copyright: Copyright (C) 2026 Ultra Librarian. All rights reserved.; Manufacturer_Part_Number: SMCJ18CA
D?#9 D?#10 = CMP-004-00035-1: Small Signal Diode, Single, 100 V, 300 Ma, 1.25 V, 4 Ns, 2 A Rohs Compliant: Yes; Forward Voltage: 715mV; Max Surge Current: 2A; Forward Current: 300mA; Pins: 2; Min Operating Temperature: -65°C; Max Operating Temperature: 150°C; Mounting Technology: Surface Mount
D?#11 D?#12 = CMP-004-00033-1: Rectifier Diode, Schottky, 1 Phase, 1 Element, 0.15A, 100V V(RRM), Silicon; Forward Voltage: 250mV; Forward Current: 150mA; Min Operating Temperature: -55°C; Pins: 2; Max Operating Temperature: 150°C
D?#13-D?#16 = BAS40W-7-F: No Description Available; Manufacturer_Name: Diodes Inc; Copyright: Copyright (C) 2026 Ultra Librarian. All rights reserved.; Manufacturer_Part_Number: BAS40W-7-F; RefDes: RefDes; Type: Type
E?#1-E?#4 = CMP-0079939-1: CompType: Spark Gap
F?#1 F?#2 = CMP-005-00014-1: Fuse Chip Fast Acting 15A 32V SMD Solder Pad 1206 T/R; Max Operating Temperature: 105°C; Min Operating Temperature: -20°C; Mounting Technology: Surface Mount; Current Rating: 15A; Case/Package: 1206
J?#1 = 1820589: PCB terminal block, nominal current: 13.5 A, nom. voltage: 200 V, pitch: 3.5 mm, number of positions: 4, connection method: Screw connection with tension sleeve, mounting: THR soldering, conductor/PCB connection direction: 0 Â°, color: black; Manufacturer_Name: Phoenix Contact; Copyright: Copyright (C) 2026 Ultra Librarian. All rights reserved.; Manufacturer_Part_Number: 1820589; RefDes: RefDes; Type: Type
J?#2 J?#7 J?#8 JX?#2 = 1985807: PCB terminal block, nominal current: 13.5 A, nom. voltage: 200 V, pitch: 3.5 mm, number of positions: 2, connection method: Screw connection with tension sleeve, mounting: THR soldering, conductor/PCB connection direction: 0 Â°, color: black. This article can be soldered in the reflow furnace together with SMD components.; Manufacturer_Name: Phoenix Contact; Copyright: Copyright (C) 2026 Ultra Librarian. All rights reserved.; Manufacturer_Part_Number: 1985807; RefDes: RefDes; Type: Type
J?#3 J?#4 J?#11 = CMP-00030-00004-1: Terminal Block, 3.5MM Pitch, Horizontal, Rising Cage Clamp, 30-16 AWG, 5 Pin; Pins: 5; Max Operating Temperature: 120°C; Min Operating Temperature: -30°C
J?#5 = 1984950: PCB terminal block, nominal current: 13.5 A, rated voltage (III/2): 200 V, nominal cross section: 1.5 mmÂ², number of potentials: 3, Number of rows: 1, Number of positions per row: 3, product range: MKDS 1/..-HT, pitch: 3.5 mm, connection method: Screw con; Manufacturer_Name: Phoenix Contact; Copyright: Copyright (C) 2026 Ultra Librarian. All rights reserved.; Manufacturer_Part_Number: 1984950; RefDes: RefDes; Type: Type
J?#6 = CMP-00030-00010-1: Connector Header, PH Series, 2 Position, 2.00mm, 100V, Surface Mount, Solder, Natural; Max Operating Temperature: 85°C; Min Operating Temperature: -25°C; Pins: 2; Mounting Technology: Surface Mount
J?#9 J?#10 = CMP-0002337-1: Header, 100mil, 2x1, Tin, TH; Manufacturer: Sullins Connector Solutions; CNHeader: TRUE; Current_A: 3A; Green_Lifecycle: Not Set; Shrouded: N; Gender: Male; Green_REACh: Incomplete; Voltage_V: 1.8kV; Row_Count: 1; Pitch_mm: 2.54; CT: FALSE; Cert_UL: Y; ComponentLink1URL: http://www.sullinscorp.com/catalogs/77_PAGE108-109_.100_MALE_HDR.pdf; ClassName: Header; Publisher: Texas Instruments; Color: Black; RoHS: Y; MountType: TH; Green_EU RoHS-2: Incomplete; Supplier 1: Digi-Key; Green_EU RoHS: Incomplete; PackageReference: Header, 2 PIN, 100mil, Tin; PinCount: 2; CompType: Header; LatestRevisionDate: 26/05/2017; PartNumber: PEC02SAAN; Orientation: Vertical; ComponentLink1Description: Datasheet URL; Supplier Part Number 1: S1012E-02-ND; ContactFinish: Tin
JX?#1 = CMP-00030-00005-1: Pin Header, Board-to-Board, 2.54 mm, 1 Rows, 3 Contacts, Through Hole, MTLW Series; Max Operating Temperature: 125°C; Min Operating Temperature: -55°C
NT?#1 NT?#2 = CMP-0078142-3: Single point connection between nets.; MountType: SMT; PackageReference: N/A; CompType: Net-Tie; Library Reference: Net-Tie; Manufacturer: N/A; PartNumber: N/A
Q?#1-Q?#4 = CMP-004-00036-1: Trans Mosfet P-ch 60V 1.1A 3-PIN SOT-23 T/r / Mosfet P-ch 60V 0.9A SOT23-3; Mounting Technology: Surface Mount; Max Operating Temperature: 150°C; Pins: 3; Case/Package: SOT-23; Min Operating Temperature: -55°C
Q?#5-Q?#8 = CMP-031-00010-1: 60-V, N channel NexFET™ power MOSFET, single SON 5 mm x 6 mm, 3.2 mOhm 8-VSON-CLIP -55 to 150; Max Operating Temperature: 150°C; Min Operating Temperature: -55°C; Pins: 8; Mounting Technology: Surface Mount
Q?#9 Q?#10 = 2N7002KW: Description; Manufacturer_Name: onsemi; Copyright: Copyright (C) 2026 Ultra Librarian. All rights reserved.; Manufacturer_Part_Number: 2N7002KW
Q?#11 Q?#12 = CMP-013-00035-1: Bipolar (BJT) Single Transistor, NPN, 80 V, 1 A, 2 W, SOT-89, Surface Mount; Frequency: 150MHz; Min Operating Temperature: -65°C; Mounting Technology: Surface Mount; Case/Package: SOT-89; Max Operating Temperature: 150°C; Pins: 4
R?#1-R?#4 = CMP-009-00193-1: Fixed Resistor, Metal Glaze/thick Film, 1W, 1000ohm, 500V, 5% +/-Tol, Surface Mount, 2512; Case/Package: 2512; Voltage Rating: 500V; Mounting Technology: Surface Mount; Tolerance: 5%; Min Operating Temperature: -55°C; Pins: 2; Max Operating Temperature: 155°C
R?#5-R?#14 R?#35 R?#36 = CMP-009-00184-1: 100mW Thick Film Resistors 75V ±5% ±200ppm/℃ 10MΩ 0603 Chip Resistor - Surface Mount ROHS; Pins: 2; Min Operating Temperature: -55°C; Tolerance: 5%; Max Operating Temperature: 155°C; Case/Package: 0603; Voltage Rating: 75V; Mounting Technology: Surface Mount
R?#15 R?#16 = CMP-009-00192-1: 333.333mW Thick Film Resistors 75V 0Ω 0603 Chip Resistor - Surface Mount ROHS; Case/Package: 0603; Max Operating Temperature: 155°C; Pins: 2; Voltage Rating: 75V; Mounting Technology: Surface Mount; Min Operating Temperature: -55°C
R?#17 R?#18 R?#21 R?#22 R?#29-R?#32 R?#47 R?#48 R?#65 R?#69 Ren? RPG? = CMP-009-00186-1: Res Thick Film 0805 10K Ohm 1% 0.125W(1/8W) ±100ppm/C Pad SMD Automotive T/R; Voltage Rating: 150V; Max Operating Temperature: 155°C; Pins: 2; Case/Package: 0805; Min Operating Temperature: -55°C; Tolerance: 1%; Mounting Technology: Surface Mount
R?#19 R?#20 = CMP-009-00191-1: Res Thick Film 0603 1K Ohm 5% 1/10W ±200ppm/°C Molded SMD SMD Paper T/R; Voltage Rating: 75V; Min Operating Temperature: -55°C; Max Operating Temperature: 155°C; Mounting Technology: Surface Mount; Pins: 2; Tolerance: 5%; Case/Package: 0603
R?#23-R?#28 = CMP-009-00190-1: Fixed Resistor, Metal Glaze/thick Film, 0.125W, 5100ohm, 150V, 5% +/-Tol, Surface Mount, 0805; Max Operating Temperature: 155°C; Min Operating Temperature: -55°C; Tolerance: 5%; Case/Package: 0805; Mounting Technology: Surface Mount; Voltage Rating: 150V; Pins: 2
R?#33 R?#34 = CMP-009-00185-1: Fixed Resistor, Metal Glaze/thick Film, 1W, 200ohm, 500V, 5% +/-Tol, Surface Mount, 2512; Max Operating Temperature: 155°C; Pins: 2; Min Operating Temperature: -55°C; Voltage Rating: 500V; Tolerance: 5%; Case/Package: 2512; Mounting Technology: Surface Mount
R?#37 R?#38 R?#51 R?#52 R?#55 R?#58 R?#59 R?#63 R?#64 = CMP-009-00188-1: 100mW Thick Film Resistors 75V ±5% ±200ppm/℃ 100Ω 0603 Chip Resistor - Surface Mount ROHS; Max Operating Temperature: 155°C; Voltage Rating: 75V; Tolerance: 5%; Mounting Technology: Surface Mount; Case/Package: 0603; Pins: 2; Min Operating Temperature: -55°C
R?#39-R?#46 R?#49 R?#50 = CMP-009-00189-1: Fixed Resistor, Metal Glaze/thick Film, 0.25W, 20ohm, 200V, 1% +/-Tol, Surface Mount, 1206; Voltage Rating: 200V; Tolerance: 1%; Pins: 2; Min Operating Temperature: -55°C; Mounting Technology: Surface Mount; Case/Package: 1206; Max Operating Temperature: 155°C
R?#53 R?#54 R?#56 R?#57 R?#60-R?#62 = CMP-009-00178-1: Res Thick Film 0805 3.3K Ohm 5% 0.125W(1/8W) ±100ppm/C Pad SMD T/R Automotive AEC-Q200; Voltage Rating: 150V; Case/Package: 0805; Max Operating Temperature: 155°C; Mounting Technology: Surface Mount; Min Operating Temperature: -55°C; Tolerance: 5%
R?#66 R?#67 = PMR25HZPFV1L00: No Description Available; Manufacturer_Name: ROHM Semiconductor; Copyright: Copyright (C) 2026 Ultra Librarian. All rights reserved.; Manufacturer_Part_Number: PMR25HZPFV1L00
R?#68 R?#70 R?#71 = CMP-009-00183-1: Res Thick Film 0603 33 Ohm 1% 0.1W(1/10W) ±100ppm/C Pad SMD T/R Automotive AEC-Q200; Voltage Rating: 75V; Case/Package: 0603; Mounting Technology: Surface Mount; Max Operating Temperature: 155°C; Tolerance: 1%; Min Operating Temperature: -55°C
RCONF? = CMP-009-00179-1: Res Hp Thkflm 0805 7.5K Ohm 1% 1/2W 100PPM/ C SMD; Voltage Rating: 150V; Mounting Technology: Surface Mount; Min Operating Temperature: -55°C; Max Operating Temperature: 155°C; Case/Package: 0805; Tolerance: 1%
Rfbb? = CMP-009-00180-1: Res Thick Film 0805 4.87K Ohm 1%; Voltage Rating: 150V; Mounting Technology: Surface Mount; Case/Package: 0805; Min Operating Temperature: -55°C; Tolerance: 1%; Max Operating Temperature: 155°C; Pins: 2
Rfbt? = CMP-009-00180-1: Res Thick Film 0805 25.5K Ohm 1% 1/8W ±100ppm/°C Molded SMD SMD Paper T/R; Voltage Rating: 150V; Mounting Technology: Surface Mount; Case/Package: 0805; Min Operating Temperature: -55°C; Tolerance: 1%; Max Operating Temperature: 155°C; Pins: 2
S?#1-S?#4 = CMP-00030-00006-2: Tactile Switch, 0.003A, 24Vdc, 160Gf/Smd Rohs Compliant: Yes; Min Operating Temperature: -40°C; Mounting Technology: Surface Mount; Max Operating Temperature: 90°C
TPSM? = CMP-006-00022-2: 17-V VIN, 3-A low-noise and low-ripple buck module with integrated ferrite bead filter compensation 28-B0QFN -40 to 125; Manufacturer_Name: Texas Instruments; RefDes: RefDes; Design Item ID: PTPSM82913RDUR; Copyright: Copyright (C) 2026 Ultra Librarian. All rights reserved.; Manufacturer_Part_Number: PTPSM82913RDUR; Source: PTPSM82913RDUR.SchLib; Type: Type
U?#1 U?#2 = CMP-00000-1: Three-series to five-series cell lithium-ion and lithium-phosphate battery monitor 32-QFN -40 to 85; Manufacturer Lifecycle Status: ACTIVE; Width: 4mm; Height: 800µm; Pins: 32; Thickness: 750µm; Length: 4mm; Lifecycle Status: Production; RoHS: Compliant
U?#3 = CMP-031-00009-2: Hot-swappable, robust-EMC bidirectional I²C Isolators with 2 GPIOs 16-SOIC -40 to 125; Manufacturer Lifecycle Status: ACTIVE; Max Junction Temperature (Tj): 150°C; Max Supply Voltage: 5.5V; Min Supply Voltage: 2.25V; Interface: I2C; Width: 7.5mm; Height: 2.65mm; RoHS: Compliant; Case/Package: SOIC; Max Operating Temperature: 125°C; Length: 10.3mm; Min Operating Temperature: -40°C; Lifecycle Status: Production; Thickness: 2.35mm; Pins: 16